# Altium schematic sheet Stara wersja zasilania.SchDoc (part 3 of 3)
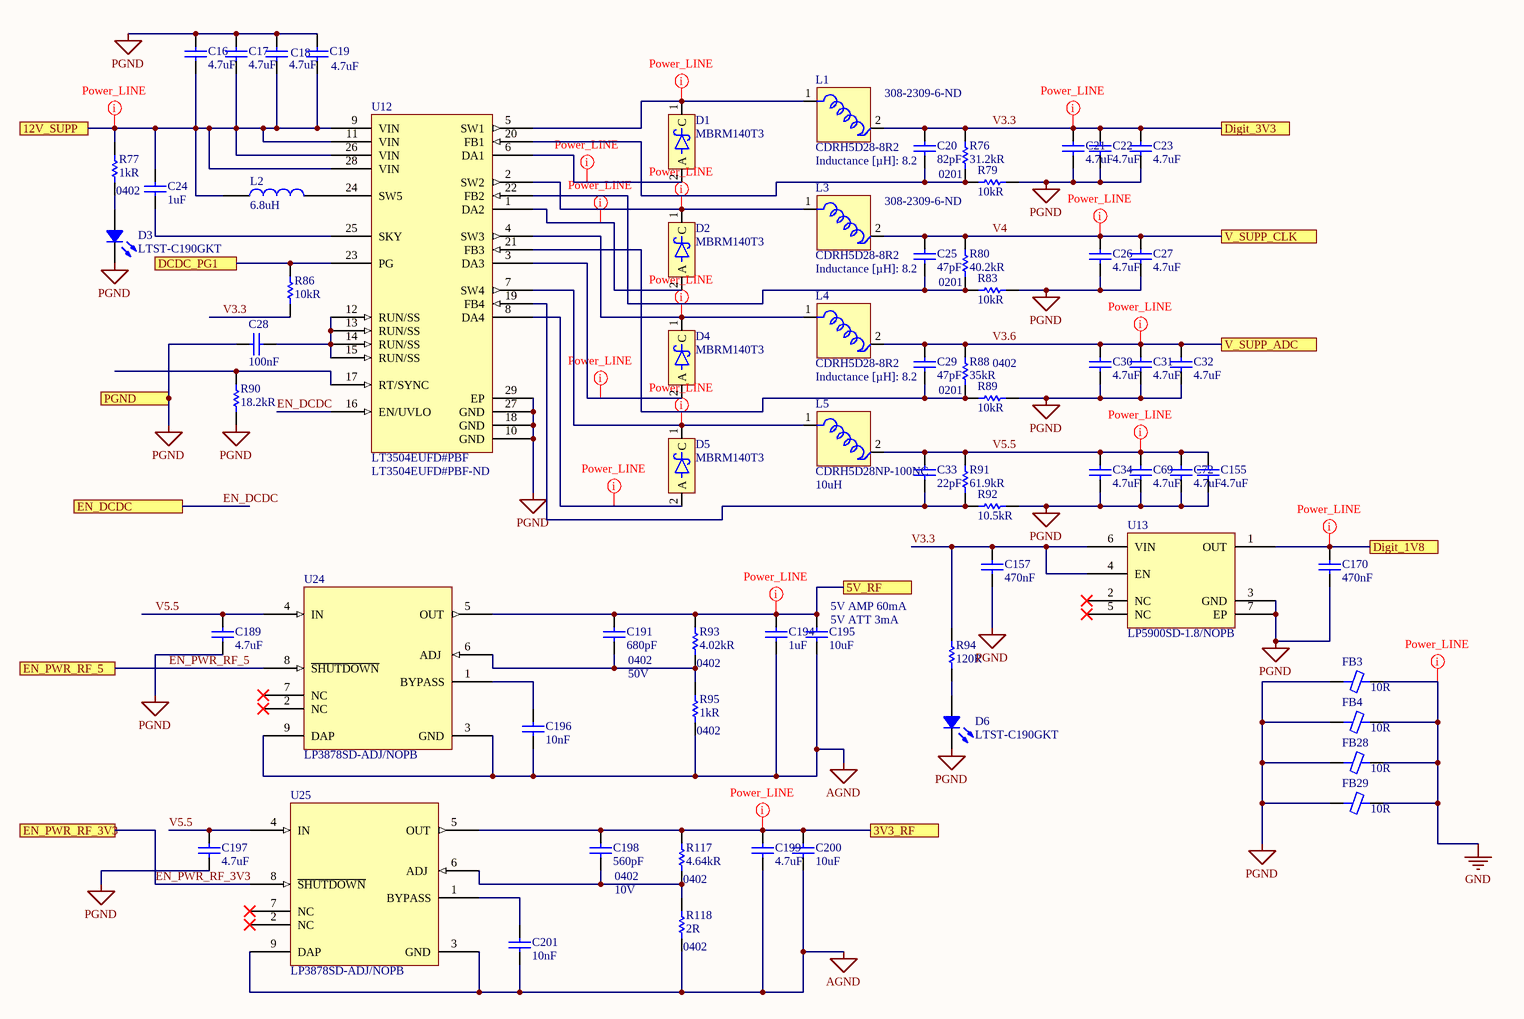
[diagram p2: Stara wersja zasilania.SchDoc]

## Library data of the parts (continued)
U12 = LT3504EUFD#PBF: LINEAR TECHNOLOGY         LT3504EUFD#PBF             BUCK, QUAD, 3.2/40V, 1A, 2.2MHZ, 28QFN; Manufacturer: Analog Devices / Linear Technology; Output Voltage: 40V; Min Input Voltage: 3.2V; Number of Outputs: 4; Switching Frequency: 2.1MHz; Synchronous Rectifier: No; Output Type: Adjustable; Supplier 1: Digi-Key; Manufacturer Part Number: LT3504EUFD#PBF; Stock 1: 1751; Pricing 1: 1 = 8,49000, 25 = 5,63840, 100 = 4,66200, 250 = 4,42892, 500 = 4,32900 (USD); RoHS: Yes; Case/Package: QFN; Number of Pins: 28; Min Operating Temperature: -40°C; Max Operating Temperature: 125°C; Package Quantity: 73; Packaging: Rail/Tube; Output Current: 1A; Current - Output 1: 1A; Current - Output 2: 1A; Voltage - Output 1: 40V; Voltage - Output 2: 40V; REACH SVHC: No SVHC; Lead Free: Lead Free; ComponentLink1URL: https://datasheet.ciiva.com/6192/1732075-6192640.pdf?src-supplier=Farnell; ComponentLink1Description: https://datasheet.ciiva.com/6192/1732075-6192640.pdf?src-supplier=Farnell; ComponentLink2URL: https://datasheet.ciiva.com/7363/1732075-7363817.pdf?src-supplier=Newark; ComponentLink2Description: https://datasheet.ciiva.com/7363/1732075-7363817.pdf?src-supplier=Newark
U13 = LP5900SD-1.8/NOPB: Ultra Low Noise, 150MA Linear Regulator For Rf/analog Circuits, 6 Pin Llp; Manufacturer 1: Texas Instruments; Output Voltage: 1.8V; Min Input Voltage: 2.5V; Max Input Voltage: 5.5V; Dropout Voltage: 150mV; Number of Outputs: 1; Polarity: Positive; Quiescent Current: 50uA; Output Voltage Accuracy: 2%; Output Type: Fixed; Supplier 1: Digi-Key; Manufacturer Part Number 1: LP5900SD-1.8/NOPB; Stock 1: 10846; Pricing 1: 1=0.77000, 10=0.68000, 100=0.52120, 500=0.41200 (USD); RoHS: Yes; Mount: Surface Mount; Number of Pins: 6; Min Operating Temperature: -40°C; Max Operating Temperature: 125°C; Output Current: 150mA; Package Quantity: 1000; Nominal Output Voltage: 1.8V; Packaging: Tape and Reel; Max Output Current: 150mA; Accuracy: 2%; Length: 2.2mm; Height: 0.8mm; Width: 2.5mm; Radiation Hardening: No; REACH SVHC: No SVHC; Lead Free: Lead Free; ComponentLink1URL: https://datasheet.ciiva.com/6598/lp5900-6598182.pdf?src-supplier=Digi-Key; ComponentLink1Description: https://datasheet.ciiva.com/6598/lp5900-6598182.pdf?src-supplier=Digi-Key; ComponentLink2URL: https://datasheet.ciiva.com/6598/lp5900-6598185.pdf?src-supplier=Digi-Key; ComponentLink2Description: https://datasheet.ciiva.com/6598/lp5900-6598185.pdf?src-supplier=Digi-Key; ComponentLink3URL: https://datasheet.ciiva.com/26175/lp5900-26175289.pdf?src-supplier=Avnet+Europe; ComponentLink3Description: https://datasheet.ciiva.com/26175/lp5900-26175289.pdf?src-supplier=Avnet+Europe; ComponentLink4URL: https://datasheet.ciiva.com/6598/lp5900-6598187.pdf?src-supplier=Digi-Key; ComponentLink4Description: https://datasheet.ciiva.com/6598/lp5900-6598187.pdf?src-supplier=Digi-Key; ComponentLink5URL: https://datasheet.ciiva.com/28643/1772310-28643116.pdf?src-supplier=Element14; ComponentLink5Description: https://datasheet.ciiva.com/28643/1772310-28643116.pdf?src-supplier=Element14; ComponentLink6URL: https://datasheet.ciiva.com/14278/lp5900-14278125.pdf?src-supplier=Avnet; ComponentLink6Description: https://datasheet.ciiva.com/14278/lp5900-14278125.pdf?src-supplier=Avnet; ComponentLink7URL: https://datasheet.ciiva.com/22678/1772310-22678013.pdf?src-supplier=Element14; ComponentLink7Description: https://datasheet.ciiva.com/22678/1772310-22678013.pdf?src-supplier=Element14; Supplier Part Number 1: LP5900SD-1.8/NOPBCT-ND
U24 U25 = LP3878SD-ADJ/NOPB: Low Dropout Regulators - LDO Micropower 800mA Low Noise Adj Vltg Reg; Manufacturer 1: Texas Instruments; Output Voltage: 5.5V; Dropout Voltage: 475mV; Min Input Voltage: 2.5V; Max Input Voltage: 16V; Number of Outputs: 1; Quiescent Current: 5.5mA; Polarity: Positive; Accuracy: 1%; Min Output Voltage: 1V; Output Type: Adjustable; Supplier 1: Digi-Key; Manufacturer Part Number 1: LP3878SD-ADJ/NOPB; Stock 1: 29951; Pricing 1: 1=2.14000, 10=1.92200, 100=1.54450, 500=1.26896 (USD); RoHS: Yes; Mount: Surface Mount; Number of Pins: 8; Contact Plating: Tin,Matte; Min Operating Temperature: -40°C; Max Operating Temperature: 125°C; Output Current: 800mA; Package Quantity: 1000; Max Output Current: 800mA; Packaging: Tape and Reel; Max Output Voltage: 5.5V; Output Voltage Accuracy: 1%; Number of Regulators: 1; Length: 4mm; Height: 0.8mm; Width: 4mm; Radiation Hardening: No; REACH SVHC: No SVHC; Lead Free: Lead Free; ComponentLink1URL: https://datasheet.ciiva.com/27052/1329588-27052012.pdf?src-supplier=Jameco; ComponentLink1Description: https://datasheet.ciiva.com/27052/1329588-27052012.pdf?src-supplier=Jameco; ComponentLink2URL: https://datasheet.ciiva.com/1571/1846896-1571038.pdf?src-supplier=Farnell; ComponentLink2Description: https://datasheet.ciiva.com/1571/1846896-1571038.pdf?src-supplier=Farnell; ComponentLink3URL: https://datasheet.ciiva.com/7992/1814893-7992723.pdf?src-supplier=Element14; ComponentLink3Description: https://datasheet.ciiva.com/7992/1814893-7992723.pdf?src-supplier=Element14; ComponentLink4URL: https://datasheet.ciiva.com/25626/0900766b810fa759-25626986.pdf?src-supplier=RSComponents; ComponentLink4Description: https://datasheet.ciiva.com/25626/0900766b810fa759-25626986.pdf?src-supplier=RSComponents; ComponentLink5URL: https://datasheet.ciiva.com/6595/lp3878-adj-6595783.pdf?src-supplier=Digi-Key; ComponentLink5Description: https://datasheet.ciiva.com/6595/lp3878-adj-6595783.pdf?src-supplier=Digi-Key; ComponentLink6URL: https://datasheet.ciiva.com/25974/lp3878-adj-25974985.pdf?src-supplier=Avnet+Europe; ComponentLink6Description: https://datasheet.ciiva.com/25974/lp3878-adj-25974985.pdf?src-supplier=Avnet+Europe; ComponentLink7URL: https://datasheet.ciiva.com/3223/lp3878-adj-3223946.pdf?src-supplier=Avnet; ComponentLink7Description: https://datasheet.ciiva.com/3223/lp3878-adj-3223946.pdf?src-supplier=Avnet; ComponentLink8URL: https://datasheet.ciiva.com/6595/lp3878-adj-6595786.pdf?src-supplier=Digi-Key; ComponentLink8Description: https://datasheet.ciiva.com/6595/lp3878-adj-6595786.pdf?src-supplier=Digi-Key; ComponentLink9URL: https://datasheet.ciiva.com/46419/lp3878-adj-46419375.pdf?src-supplier=Element14; ComponentLink9Description: https://datasheet.ciiva.com/46419/lp3878-adj-46419375.pdf?src-supplier=Element14; Supplier Part Number 1: LP3878SD-ADJ/NOPBCT-ND